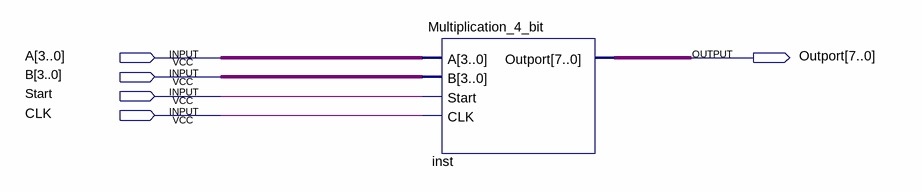
[diagram p0: schematic sheet]
// Quartus schematic cau01_done.bdf as structural Verilog: 1 symbols, 5 pins
module cau01_done (
  input  [3:0] A,
  input  [3:0] B,
  input  Start,
  input  CLK,
  output [7:0] Outport
);

  Multiplication_4_bit inst (.A(A), .B(B), .Start(Start), .CLK(CLK), .Outport(Outport));
endmodule
